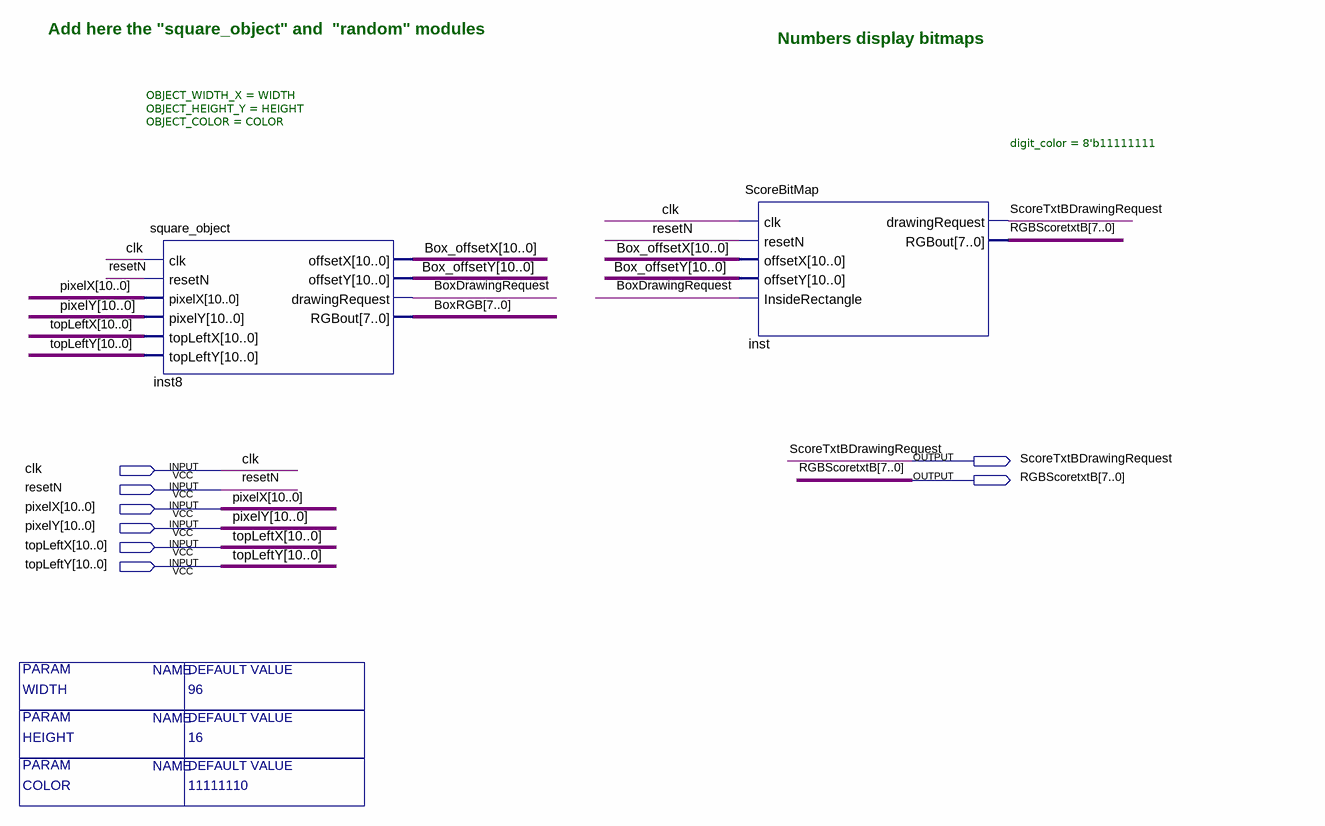
[diagram p0: schematic sheet]
// Quartus schematic ScoreB.bdf as structural Verilog: 2 symbols, 8 pins
module ScoreB #(parameter COLOR = 11111110, parameter HEIGHT = 16, parameter WIDTH = 96) (
  input  clk,
  input  resetN,
  input  [10:0] pixelX,
  input  [10:0] pixelY,
  input  [10:0] topLeftX,
  input  [10:0] topLeftY,
  output ScoreTxtBDrawingRequest,
  output [7:0] RGBScoretxtB
);

  wire BoxDrawingRequest;
  wire [7:0] BoxRGB;
  wire [10:0] Box_offsetX, Box_offsetY;

  square_object #(.OBJECT_WIDTH_X(WIDTH), .OBJECT_HEIGHT_Y(HEIGHT), .OBJECT_COLOR(COLOR)) inst8 (
    .clk(clk), .resetN(resetN), .pixelX(pixelX), .pixelY(pixelY), .topLeftX(topLeftX), .topLeftY(topLeftY),
    .offsetX(Box_offsetX), .offsetY(Box_offsetY), .drawingRequest(BoxDrawingRequest), .RGBout(BoxRGB));
  ScoreBitMap #(.digit_color(8'b11111111)) inst (
    .clk(clk), .resetN(resetN), .offsetX(Box_offsetX), .offsetY(Box_offsetY),
    .InsideRectangle(BoxDrawingRequest), .drawingRequest(ScoreTxtBDrawingRequest), .RGBout(RGBScoretxtB));

  // Notes on the sheet:
  //   Add here the "square_object" and  "random" modules
  //   Numbers display bitmaps
endmodule
